# Altium project 可调稳压模块.PrjPcb
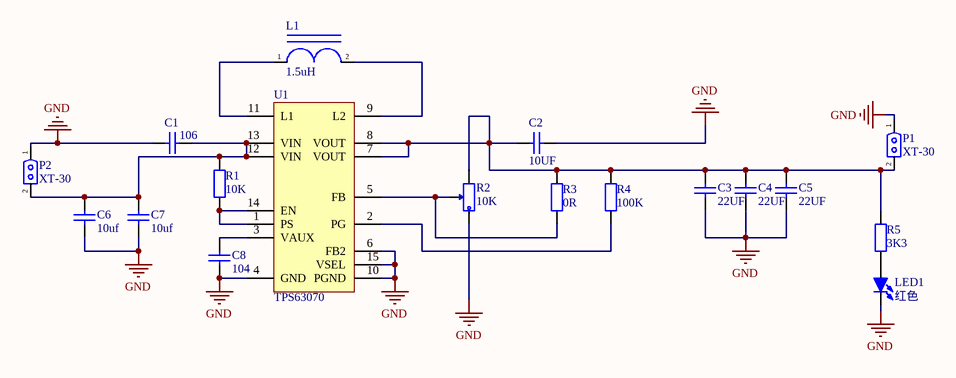
[diagram p0: 可调稳压模块.SchDoc]
1 sheet, 18 parts. Net scope: global (net labels, ports and power ports of the same name join across sheets).
Board file: 可调稳压模块.PcbDoc

## Sheet 可调稳压模块.SchDoc
size A4; SheetNumber: 1; SheetTotal: 1

### Parts
C1  106  [0805_C]
C2  10UF  [0805_C]
C3  22UF  [0805_C]
C4  22UF  [0805_C]
C5  22UF  [0805_C]
C6  10uf  [0805_C]
C7  10uf  [0805_C]
C8  104  [0805_C]
L1  1.5uH  [IND-SMD_L7.0-W6.6_FXL0630]
LED1  红色  [LED 0805B]
P1  XT-30  [xt-30]
P2  XT-30  [xt-30]
R1  10K  [0805_R]
R2  10K  [3296W]
R3  0R  [0805_R]
R4  100K  [0805_R]
R5  3K3  [0805_R]
U1  TPS63070  [LQ_VQFN15]

### Nets
GND: C1.2 C2.1 C3.2 C4.2 C5.2 C6.2 C7.2 C8.2 LED1.2(K) P1.1 P2.1 R2.1 U1.4(GND) U1.6(FB2) U1.10(PGND) U1.15(VSEL)
NetC1_1: C1.1 C6.1 C7.1 P2.2 R1.2 U1.12(VIN) U1.13(VIN)
NetC2_2: C2.2 C3.1 C4.1 C5.1 P1.2 R2.3 R3.2 R4.2 R5.2 U1.7(VOUT) U1.8(VOUT)
NetC8_1: C8.1 U1.3(VAUX)
NetL1_1: L1.1 U1.11(L1)
NetL1_2: L1.2 U1.9(L2)
NetLED1_1: LED1.1(A) R5.1
NetR1_1: R1.1 U1.1(PS) U1.14(EN)
NetR2_2: R2.2 R3.1 U1.5(FB)
NetR4_1: R4.1 U1.2(PG)

### Library data of the parts
C1-C8 = 0805 12pF (120) 5% 50V: 贴片电容; ComponentLink1Description: 供应商链接; ComponentLink1URL: http://www.szlcsc.com/product/details_2144.html; Package: 0805; Supplier: LC; SuppliersPartNumber: C1792
L1 = L_1: 一体化成型电感
LED1 = LED-5MM: 0805LED; BOM名称: 5mm插件LED; 版权归属: 源创客; 学习资源: www.ooocke.com
P1 P2 = XT-30: 接口
R1 R3-R5 = 0805 13KΩ (1302) 1%: 贴片电阻; ComponentLink1Description: 供应商链接; ComponentLink1URL: http://www.szlcsc.com/product/details_18143.html; Package: 0805; Supplier: LC; SuppliersPartNumber: C17455
R2 = RP-ID: 插件单联电位器; BOM名称: 插件电位器; 版权归属: 源创客; 学习资源: www.ooocke.com